# Altium project DT10965_MOTOR_CONTROLLER(1).PrjPcb (part 1 of 5)
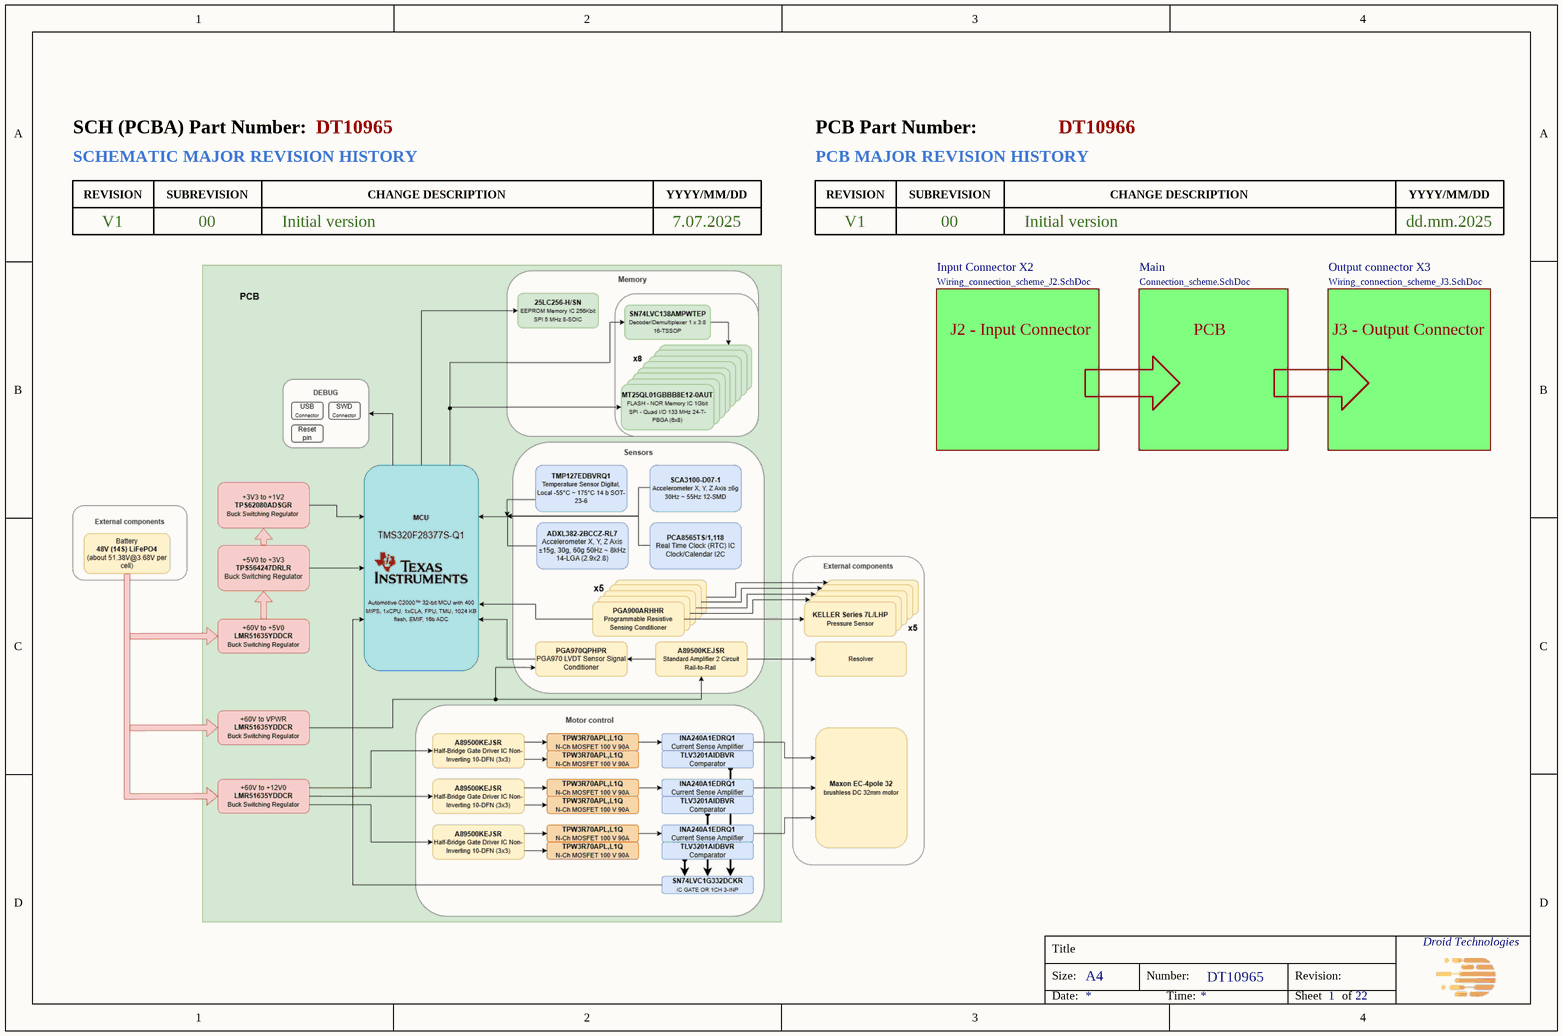
[diagram p0: Title.SchDoc]
CompanyName: Droid Technologies; DT_PCB_Number: DT10966; DT_PCB_Revision: 1.0; DT_SCH_Number: DT10965; DT_SCH_Revision: 1.0; DT_SCH_Title: MOTORCONTROLLER
16 sheets, 536 parts. Net scope: flat (ports and power ports of the same name join across sheets).
Sheets:
  Title.SchDoc
  Block_Diagram.SchDoc
  MCU.SchDoc
  MCU_debug.SchDoc
  Flash_memory.SchDoc
  EEPROM_memory.SchDoc
  Temp_sensor.SchDoc
  Accelerometers.SchDoc
  H-bridge.SchDoc
  Phase Current_Voltage Sense.SchDoc
  Resolver.SchDoc
  Pressure_sensor_AFE.SchDoc
  Calendar.SchDoc
  USB_interface.SchDoc
  Power_management.SchDoc
  Connections.SchDoc

## Sheet Title.SchDoc: =DT_SCH_Title
size A4; Organization: Droid Technologies; DocumentNumber: DT10965; Revision: 1.0; SheetNumber: 1; SheetTotal: 22

### Sub-sheets
Input Connector X2 = Wiring_connection_scheme_J2.SchDoc (file not in this document): no entries
Main = Connection_scheme.SchDoc (file not in this document): no entries
Output connector X3 = Wiring_connection_scheme_J3.SchDoc (file not in this document): no entries

### Notes on the sheet
- V1
- 00
- Initial version
- 7.07.2025
- dd.mm.2025
- J2 - Input Connector
- PCB
- J3 - Output Connector
- SCHEMATIC MAJOR REVISION HISTORY
- SCH (PCBA) Part Number:
- PCB MAJOR REVISION HISTORY
- PCB Part Number:
- REVISION
- SUBREVISION
- CHANGE DESCRIPTION
- YYYY/MM/DD
- Title
- Size:
- A4
- Number:
- Revision:
- Date:
- Time:
- Sheet
- of

## Sheet Block_Diagram.SchDoc: =DT_SCH_Title
size A4; Organization: Droid Technologies; DocumentNumber: DT10965; Revision: 1.0; SheetNumber: 2; SheetTotal: 16

### Notes on the sheet
- Title
- Size:
- A4
- Number:
- Revision:
- Date:
- Time:
- Sheet
- of
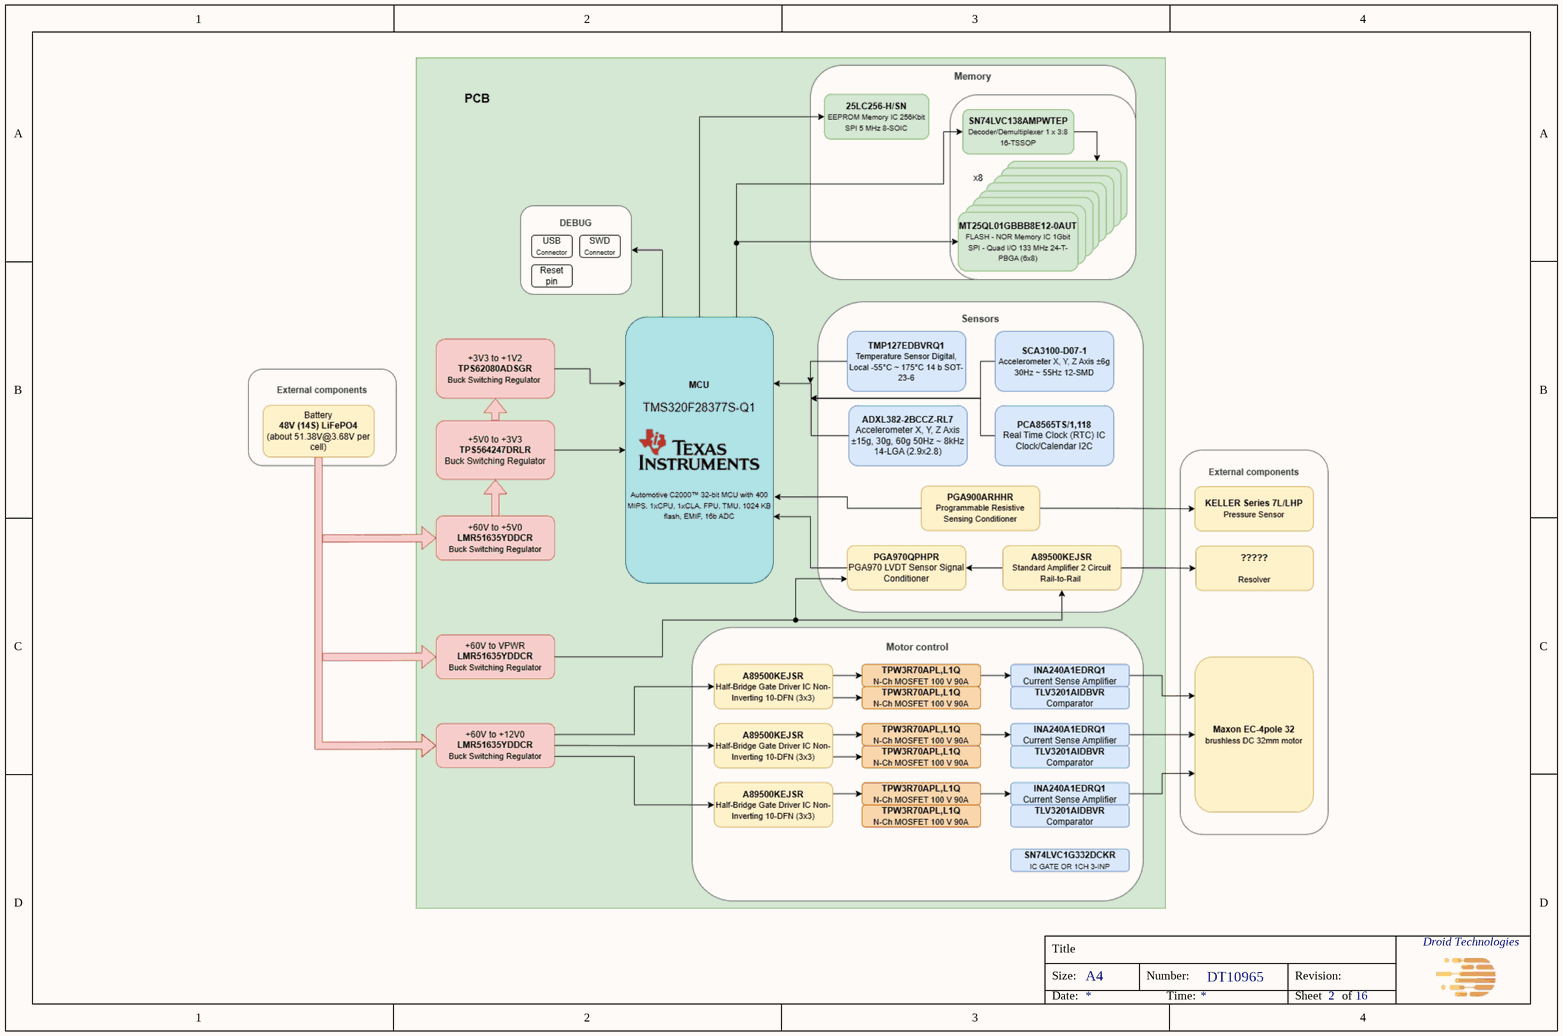
[diagram p1: Block_Diagram.SchDoc]

## Sheet MCU.SchDoc: =DT_SCH_Title
size A3; Organization: Droid Technologies; DocumentNumber: DT10965; Revision: 1.0; SheetNumber: 3; SheetTotal: 20
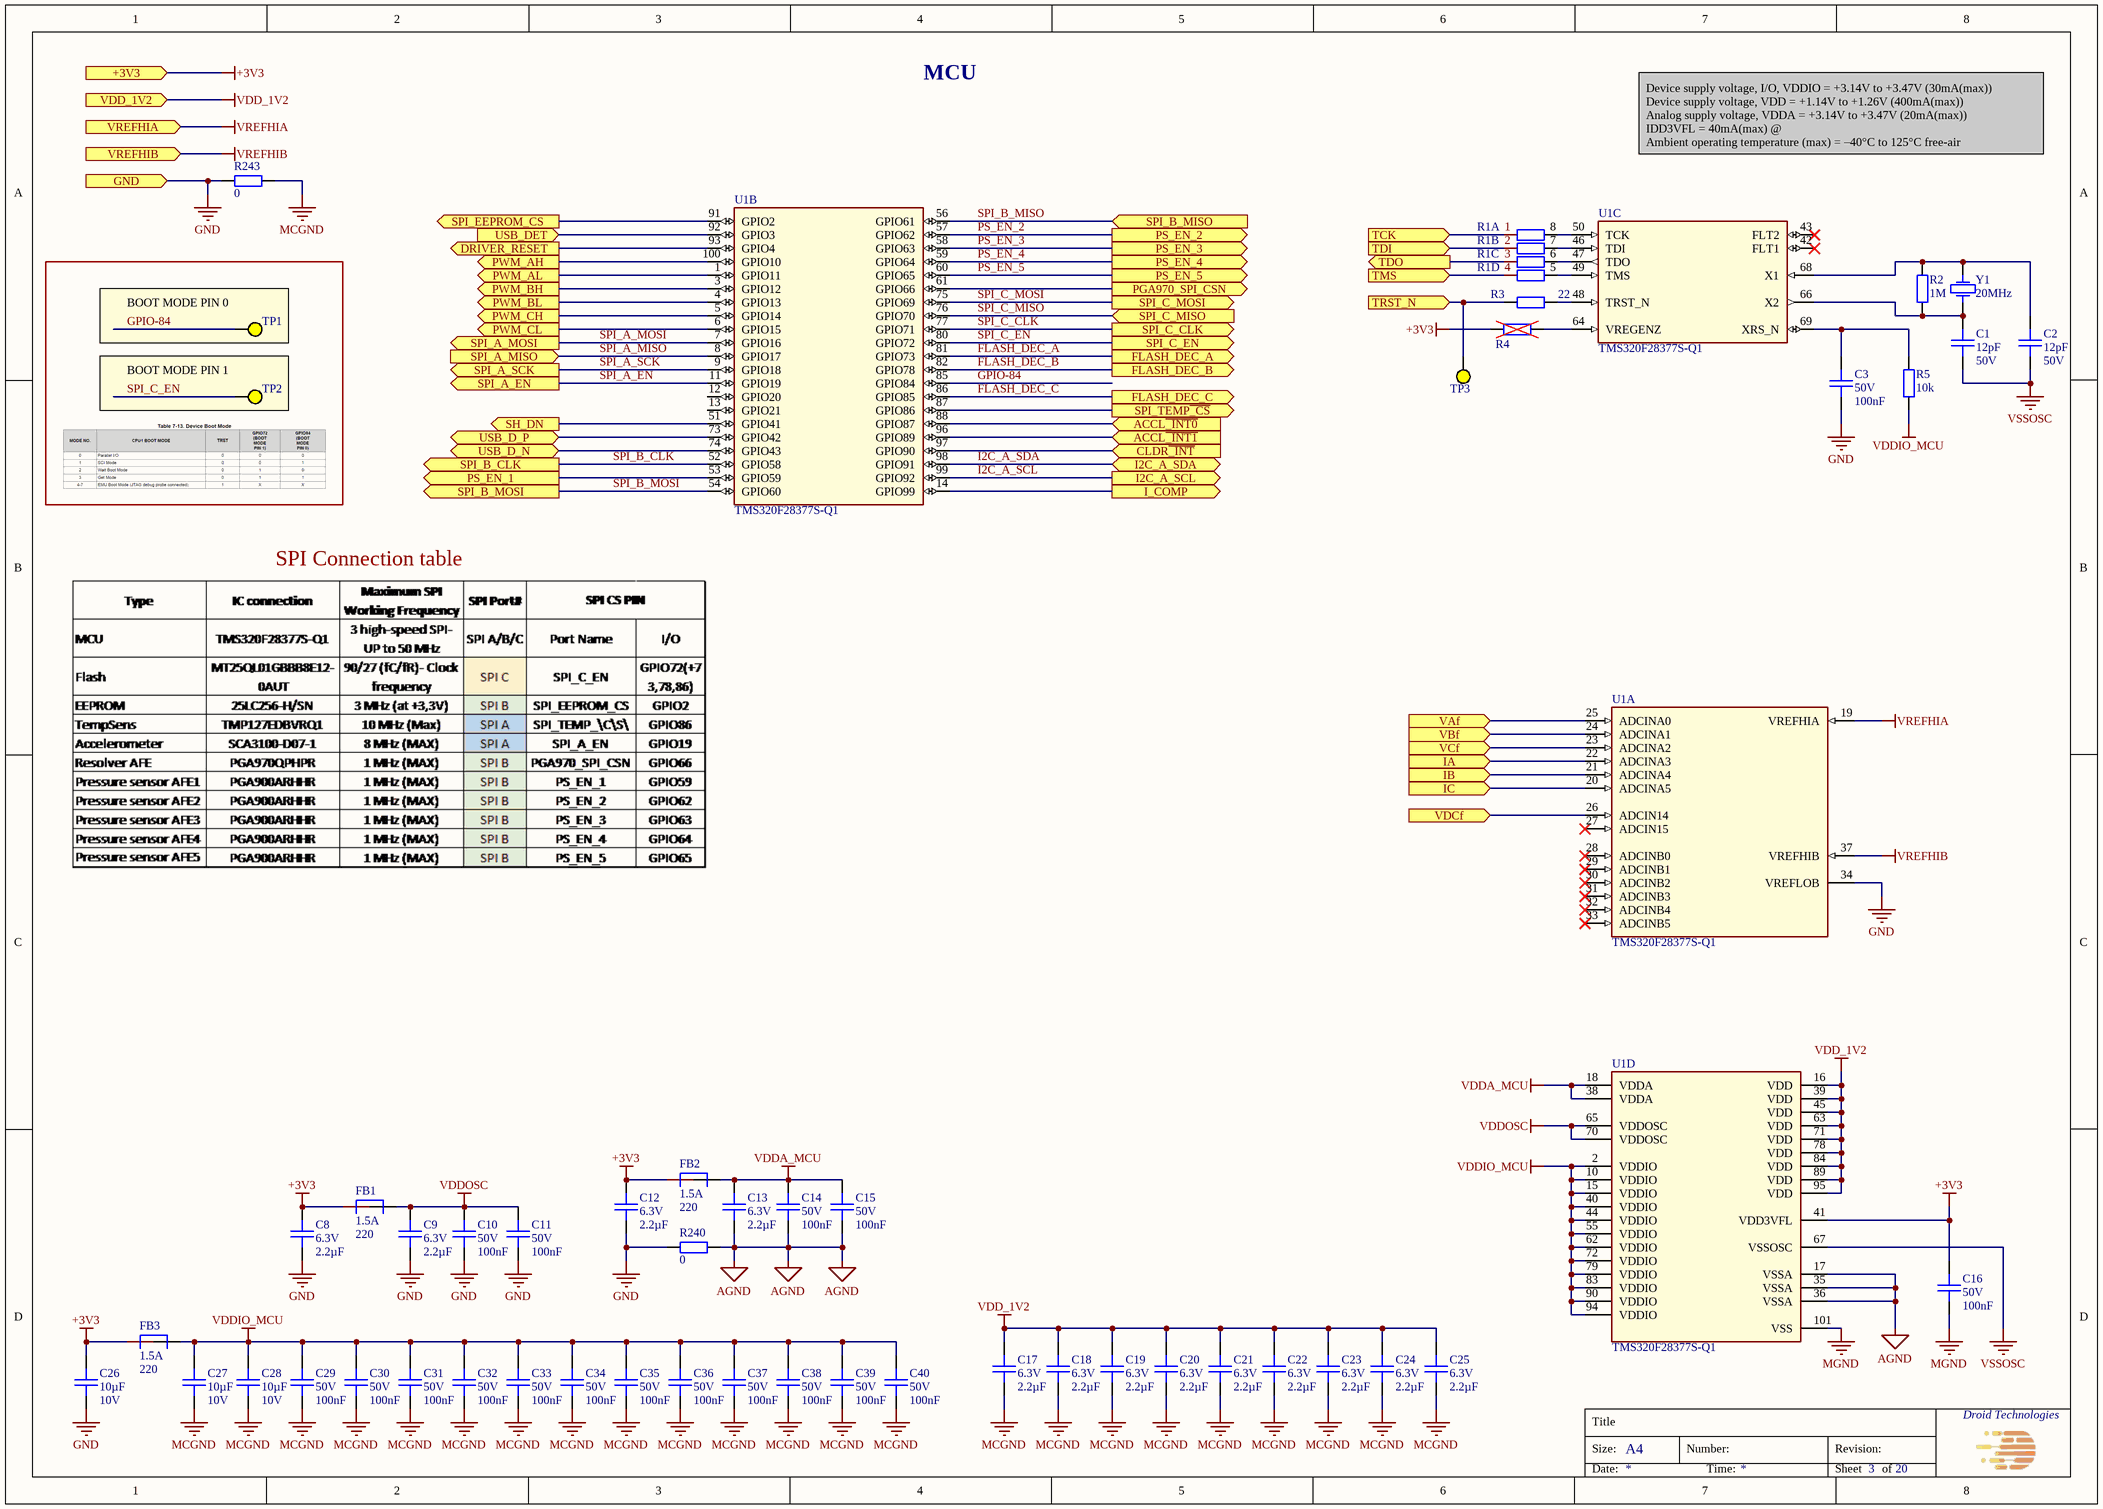
[diagram p2: MCU.SchDoc]

### Parts
C1  Capacitance: 12pF  Voltage Rating: 50V  [CAPC100x50x50L25]  (hidden comment: C0402C120J5HACAUTO)
C2  Capacitance: 12pF  Voltage Rating: 50V  [CAPC100x50x50L25]  (hidden comment: C0402C120J5HACAUTO)
C3  Voltage Rating: 50V  Capacitance: 100nF  [CAPC100x50x50L25]  (hidden comment: GCM155L8EH104KE07D)
C8  Voltage Rating: 6.3V  Capacitance: 2.2µF  [CAPC160X80X90L35]  (hidden comment: C1608X8L0J225K080AC)
C9  Voltage Rating: 6.3V  Capacitance: 2.2µF  [CAPC160X80X90L35]  (hidden comment: C1608X8L0J225K080AC)
C10  Voltage Rating: 50V  Capacitance: 100nF  [CAPC100x50x50L25]  (hidden comment: GCM155L8EH104KE07D)
C11  Voltage Rating: 50V  Capacitance: 100nF  [CAPC100x50x50L25]  (hidden comment: GCM155L8EH104KE07D)
C12  Voltage Rating: 6.3V  Capacitance: 2.2µF  [CAPC160X80X90L35]  (hidden comment: C1608X8L0J225K080AC)
C13  Voltage Rating: 6.3V  Capacitance: 2.2µF  [CAPC160X80X90L35]  (hidden comment: C1608X8L0J225K080AC)
C14  Voltage Rating: 50V  Capacitance: 100nF  [CAPC100x50x50L25]  (hidden comment: GCM155L8EH104KE07D)
C15  Voltage Rating: 50V  Capacitance: 100nF  [CAPC100x50x50L25]  (hidden comment: GCM155L8EH104KE07D)
C16  Voltage Rating: 50V  Capacitance: 100nF  [CAPC100x50x50L25]  (hidden comment: GCM155L8EH104KE07D)
C17  Voltage Rating: 6.3V  Capacitance: 2.2µF  [CAPC160X80X90L35]  (hidden comment: C1608X8L0J225K080AC)
C18  Voltage Rating: 6.3V  Capacitance: 2.2µF  [CAPC160X80X90L35]  (hidden comment: C1608X8L0J225K080AC)
C19  Voltage Rating: 6.3V  Capacitance: 2.2µF  [CAPC160X80X90L35]  (hidden comment: C1608X8L0J225K080AC)
C20  Voltage Rating: 6.3V  Capacitance: 2.2µF  [CAPC160X80X90L35]  (hidden comment: C1608X8L0J225K080AC)
C21  Voltage Rating: 6.3V  Capacitance: 2.2µF  [CAPC160X80X90L35]  (hidden comment: C1608X8L0J225K080AC)
C22  Voltage Rating: 6.3V  Capacitance: 2.2µF  [CAPC160X80X90L35]  (hidden comment: C1608X8L0J225K080AC)
C23  Voltage Rating: 6.3V  Capacitance: 2.2µF  [CAPC160X80X90L35]  (hidden comment: C1608X8L0J225K080AC)
C24  Voltage Rating: 6.3V  Capacitance: 2.2µF  [CAPC160X80X90L35]  (hidden comment: C1608X8L0J225K080AC)
C25  Voltage Rating: 6.3V  Capacitance: 2.2µF  [CAPC160X80X90L35]  (hidden comment: C1608X8L0J225K080AC)
C26  Capacitance: 10µF  Voltage Rating: 10V  [CAPC200X125X145L50]  (hidden comment: CGA4J1X8L1A106K125AC)
C27  Capacitance: 10µF  Voltage Rating: 10V  [CAPC200X125X145L50]  (hidden comment: CGA4J1X8L1A106K125AC)
C28  Capacitance: 10µF  Voltage Rating: 10V  [CAPC200X125X145L50]  (hidden comment: CGA4J1X8L1A106K125AC)
C29  Voltage Rating: 50V  Capacitance: 100nF  [CAPC100x50x50L25]  (hidden comment: GCM155L8EH104KE07D)
C30  Voltage Rating: 50V  Capacitance: 100nF  [CAPC100x50x50L25]  (hidden comment: GCM155L8EH104KE07D)
C31  Voltage Rating: 50V  Capacitance: 100nF  [CAPC100x50x50L25]  (hidden comment: GCM155L8EH104KE07D)
C32  Voltage Rating: 50V  Capacitance: 100nF  [CAPC100x50x50L25]  (hidden comment: GCM155L8EH104KE07D)
C33  Voltage Rating: 50V  Capacitance: 100nF  [CAPC100x50x50L25]  (hidden comment: GCM155L8EH104KE07D)
C34  Voltage Rating: 50V  Capacitance: 100nF  [CAPC100x50x50L25]  (hidden comment: GCM155L8EH104KE07D)
C35  Voltage Rating: 50V  Capacitance: 100nF  [CAPC100x50x50L25]  (hidden comment: GCM155L8EH104KE07D)
C36  Voltage Rating: 50V  Capacitance: 100nF  [CAPC100x50x50L25]  (hidden comment: GCM155L8EH104KE07D)
C37  Voltage Rating: 50V  Capacitance: 100nF  [CAPC100x50x50L25]  (hidden comment: GCM155L8EH104KE07D)
C38  Voltage Rating: 50V  Capacitance: 100nF  [CAPC100x50x50L25]  (hidden comment: GCM155L8EH104KE07D)
C39  Voltage Rating: 50V  Capacitance: 100nF  [CAPC100x50x50L25]  (hidden comment: GCM155L8EH104KE07D)
C40  Voltage Rating: 50V  Capacitance: 100nF  [CAPC100x50x50L25]  (hidden comment: GCM155L8EH104KE07D)
FB1  Imax: 1.5A  Impedance: 220  [BEADC160X80X95L40]  (hidden comment: BLM18KG221BH1D)
FB2  Imax: 1.5A  Impedance: 220  [BEADC160X80X95L40]  (hidden comment: BLM18KG221BH1D)
FB3  Imax: 1.5A  Impedance: 220  [BEADC160X80X95L40]  (hidden comment: BLM18KG221BH1D)
R1  EXB-N8V220JX  [RESCAV8P50_200X100X55L30X30]  (value not drawn)  (parts A,B,C,D of 4)
R2  Resistance: 1M  [RESC100X50X40L25]  (hidden comment: RC0402FR-071ML)
R3  Resistance: 22  [RESC100X50X40L25]  (hidden comment: RC0402FR-0722RL)
R4  DNP chip res 0603  [RESC160X80X55L30]  (value not drawn)
R5  Resistance: 10k  [RESC100X50X40L25]  (hidden comment: RC0402FR-0710KL)
R240  Resistance: 0  [RESC160X80X55L30]  (hidden comment: RC0603FR-070RL)
R243  Resistance: 0  [RESC160X80X55L30]  (hidden comment: RC0603FR-070RL)
TP1  Test Point  [TP_D1.5mm]  (value not drawn)  (no BOM)
TP2  Test Point  [TP_D1.5mm]  (value not drawn)  (no BOM)
TP3  Test Point  [TP_D0.75mm]  (value not drawn)
U1  TMS320F28377S-Q1  [100-HTQFP (14x14)]  (parts A,B,C,D of 4)
Y1  20MHz  [NX5032GA]

### Blocks framed on the sheet
BOOT MODE PIN 0: TP1
BOOT MODE PIN 1: TP2

### Ports
+3V3 (in), ACCL~{_INT0} (in), ACCL~{_INT1} (in), CLDR~{_INT} (in), DRIVER_RESET (out), FLASH_DEC_A (out), FLASH_DEC_B (out), FLASH_DEC_C (out), GND (in), I2C_A_SCL (out), I2C_A_SDA (bidir), I_COMP (out), IA (in), IB (in), IC (in), PGA970_SPI_CSN (out), PS_EN_1 (out), PS_EN_2 (out), PS_EN_3 (out), PS_EN_4 (out), PS_EN_5 (out), PWM_AH (out), PWM_AL (out), PWM_BH (out), PWM_BL (out), PWM_CH (out), PWM_CL (out), SH_DN (out), SPI_A_EN (out), SPI_A_MISO (in), SPI_A_MOSI (out), SPI_A_SCK (out), SPI_B_CLK (out), SPI_B_MISO (in), SPI_B_MOSI (out), SPI_C_CLK (out), SPI_C_EN (out), SPI_C_MISO (in), SPI_C_MOSI (out), SPI_EEPROM_CS (out), SPI_TEMP~{_CS} (out), TCK (in), TDI (in), TDO (out), TMS (in), TRST_N (in), USB_D_N (bidir), USB_D_P (bidir), USB_DET (in), VAf (in), VBf (in), VCf (in), VDCf (in), VDD_1V2 (in), VREFHIA (in), VREFHIB (in)

### Nets
+3V3: C8.2 C12.2 C16.2 C26.2 FB1.1 FB2.1 FB3.1 R4.2 U1.41(VDD3VFL) ; port +3V3
AGND: C13.1 C14.1 C15.1 R240.1 U1.17(VSSA) U1.35(VSSA) U1.36(VSSA)
GND: C3.1 C8.1 C9.1 C10.1 C11.1 C12.1 C26.1 R240.2 R243.2 U1.34(VREFLOB) ; port GND
MCGND: C17.1 C18.1 C19.1 C20.1 C21.1 C22.1 C23.1 C24.1 C25.1 C27.1 C28.1 C29.1 C30.1 C31.1 C32.1 C33.1 C34.1 C35.1 C36.1 C37.1 C38.1 C39.1 C40.1 R243.1
MGND: C16.1 U1.101(VSS)
VDD_1V2: C17.2 C18.2 C19.2 C20.2 C21.2 C22.2 C23.2 C24.2 C25.2 U1.16(VDD) U1.39(VDD) U1.45(VDD) U1.63(VDD) U1.71(VDD) U1.78(VDD) U1.84(VDD) U1.89(VDD) U1.95(VDD) ; port VDD_1V2
VDDA_MCU: C13.2 C14.2 C15.2 FB2.2 U1.18(VDDA) U1.38(VDDA)
VDDIO_MCU: C27.2 C28.2 C29.2 C30.2 C31.2 C32.2 C33.2 C34.2 C35.2 C36.2 C37.2 C38.2 C39.2 C40.2 FB3.2 R5.1 U1.2(VDDIO) U1.10(VDDIO) U1.15(VDDIO) U1.40(VDDIO) U1.44(VDDIO) U1.55(VDDIO) U1.62(VDDIO) U1.72(VDDIO) U1.79(VDDIO) U1.83(VDDIO) U1.90(VDDIO) U1.94(VDDIO)
VDDOSC: C9.2 C10.2 C11.2 FB1.2 U1.65(VDDOSC) U1.70(VDDOSC)
VREFHIA: U1.19(VREFHIA) ; port VREFHIA
VREFHIB: U1.37(VREFHIB) ; port VREFHIB
VSSOSC: C1.2 C2.2 U1.67(VSSOSC)
ACCL~{_INT0}: U1.88(GPIO87) ; port ACCL~{_INT0}
ACCL~{_INT1}: U1.96(GPIO89) ; port ACCL~{_INT1}
CLDR~{_INT}: U1.97(GPIO90) ; port CLDR~{_INT}
FLASH_DEC_A: U1.81(GPIO73) ; port FLASH_DEC_A
FLASH_DEC_B: U1.82(GPIO78) ; port FLASH_DEC_B
FLASH_DEC_C: U1.86(GPIO85) ; port FLASH_DEC_C
GPIO-84: TP1.1 U1.85(GPIO84)
I2C_A_SCL: U1.99(GPIO92) ; port I2C_A_SCL
I2C_A_SDA: U1.98(GPIO91) ; port I2C_A_SDA
I_COMP: U1.14(GPIO99) ; port I_COMP
IA: U1.22(ADCINA3) ; port IA
IB: U1.21(ADCINA4) ; port IB
IC: U1.20(ADCINA5) ; port IC
PS_EN_2: U1.57(GPIO62) ; port PS_EN_2
PS_EN_3: U1.58(GPIO63) ; port PS_EN_3
PS_EN_4: U1.59(GPIO64) ; port PS_EN_4
PS_EN_5: U1.60(GPIO65) ; port PS_EN_5
SPI_A_EN: U1.11(GPIO19) ; port SPI_A_EN
SPI_A_MISO: U1.8(GPIO17) ; port SPI_A_MISO
SPI_A_MOSI: U1.7(GPIO16) ; port SPI_A_MOSI
SPI_A_SCK: U1.9(GPIO18) ; port SPI_A_SCK
SPI_B_CLK: U1.52(GPIO58) ; port SPI_B_CLK
SPI_B_MISO: U1.56(GPIO61) ; port SPI_B_MISO
SPI_B_MOSI: U1.54(GPIO60) ; port SPI_B_MOSI
SPI_C_CLK: U1.77(GPIO71) ; port SPI_C_CLK
SPI_C_EN: TP2.1 U1.80(GPIO72) ; port SPI_C_EN
SPI_C_MISO: U1.76(GPIO70) ; port SPI_C_MISO
SPI_C_MOSI: U1.75(GPIO69) ; port SPI_C_MOSI
SPI_EEPROM_CS: U1.91(GPIO2) ; port SPI_EEPROM_CS
USB_D_N: U1.74(GPIO43) ; port USB_D_N
USB_D_P: U1.73(GPIO42) ; port USB_D_P
USB_DET: U1.92(GPIO3) ; port USB_DET
NetC1_1: C1.1 R2.1 U1.66(X2) Y1.1
NetC2_1: C2.1 R2.2 U1.68(X1) Y1.2
NetC3_2: C3.2 R5.2 U1.69(XRS_N)
NetJ1_1: R1.4 ; port TMS
NetJ1_2: R3.1 TP3.1 ; port TRST_N
NetJ1_3: R1.2 ; port TDI
NetJ1_7: R1.3 ; port TDO
NetJ1_9: R1.1 ; port TCK
NetR1_5: R1.5 U1.49(TMS)
NetR1_6: R1.6 U1.47(TDO)
NetR1_7: R1.7 U1.46(TDI)
NetR1_8: R1.8 U1.50(TCK)
NetR3_2: R3.2 U1.48(TRST_N)
NetR4_1: R4.1 U1.64(VREGENZ)
NetR92_1: U1.87(GPIO86) ; port SPI_TEMP~{_CS}
NetR115_1: U1.100(GPIO10) ; port PWM_AH
NetR117_1: U1.1(GPIO11) ; port PWM_AL
NetR120_1: U1.3(GPIO12) ; port PWM_BH
NetR122_1: U1.4(GPIO13) ; port PWM_BL
NetR125_1: U1.5(GPIO14) ; port PWM_CH
NetR127_1: U1.6(GPIO15) ; port PWM_CL
NetR169_2: U1.51(GPIO41) ; port SH_DN
NetR171_2: U1.61(GPIO66) ; port PGA970_SPI_CSN
NetU1_23: U1.23(ADCINA2) ; port VCf
NetU1_24: U1.24(ADCINA1) ; port VBf
NetU1_25: U1.25(ADCINA0) ; port VAf
NetU1_26: U1.26(ADCIN14) ; port VDCf
NetU1_53: U1.53(GPIO59) ; port PS_EN_1
NetU1_93: U1.93(GPIO4) ; port DRIVER_RESET

Not connected (* = marked no-connect by the designer): U1 12(GPIO20) 13(GPIO21) 27(ADCIN15)* 28(ADCINB0)* 29(ADCINB1)* 30(ADCINB2)* 31(ADCINB3)* 32(ADCINB4)* 33(ADCINB5)* 42(FLT1)* 43(FLT2)*

### Notes on the sheet
- MCU
- Device supply voltage, I/O, VDDIO = +3.14V to +3.47V (30mA(max))
  Device supply voltage, VDD = +1.14V to +1.26V (400mA(max))
  Analog supply voltage, VDDA = +3.14V to +3.47V (20mA(max))
  IDD3VFL = 40mA(max) @
  Ambient operating temperature (max) = –40°C to 125°C free-air
- SPI Connection table
- Title
- Size:
- A4
- Number:
- Revision:
- Date:
- Time:
- Sheet
- of

### Library data of the parts
C1 C2 = CMP-001-2042-2: CAP CER 0402 12PF 50V ULTRA STAB; Manufacturer: KEMET; Tolerance: 5%; Op Temp min: -55°C; Dielectric: X8R; Op Temp max: 150°C; ComponentLink3URL: https://www.digikey.com/en/products/detail/kemet/C0402C120J5HACAUTO/7955501; ComponentLink1Description: Datasheet; ComponentLink2URL: https://eu.mouser.com/ProductDetail/KEMET/C0402C120J5HACAUTO?qs=j%252B1pi9TdxUZTSOjjZ2f5wA%3D%3D; Size: 1.00mm x 0.50mm; ComponentLink2Description: Mouser; Ratings: AEC-Q200; ComponentLink3Description: Digikey; Mounting Type: SM; Lead Spacing: 0mm; MPN: C0402C120J5HACAUTO; ComponentLink1URL: https://search.kemet.com/component-documentation/download/specsheet/C0402C120J5HACAUTO; Height max: 550µm; Package: 0402 (1005 Metric)
C3 C10 C11 C14-C16 C29-C40 = CMP-001-1980-2: CAP CER 0.1UF 50V X8L 0402; Manufacturer: Murata Electronics; Op Temp max: 150°C; Op Temp min: -55°C; Tolerance: 10%; Height max: 550µm; ComponentLink3Description: Digikey; Mounting Type: SM; ComponentLink3URL: https://www.digikey.com/en/products/detail/murata-electronics/GCM155L8EH104KE07D/11618823; Package: 0402 (1005 Metric); Lead Spacing: 0mm; MPN: GCM155L8EH104KE07D; Size: 1.00mm x 0.50mm; Ratings: AEC-Q200; ComponentLink1URL: https://www.murata.com/en-us/products/productdetail?partno=GCM155L8EH104KE07%23; ComponentLink1Description: Datasheet; Dielectric: X8L; ComponentLink2Description: Mouser; ComponentLink2URL: https://eu.mouser.com/ProductDetail/Murata-Electronics/GCM155L8EH104KE07D?qs=1mbolxNpo8fQSHf0HYnZWw%3D%3D
C8 C9 C12 C13 C17-C25 = CMP-001-2044-2: CAP CER 2.2UF 6.3V X8L 0603; Manufacturer: TDK Corporation; Op Temp min: -55°C; Tolerance: 10%; Op Temp max: 150°C; ComponentLink1URL: https://product.tdk.com/en/search/capacitor/ceramic/mlcc/info?part_no=C1608X8L0J225K080AC; MPN: C1608X8L0J225K080AC; ComponentLink3URL: https://www.digikey.com/en/products/detail/tdk-corporation/C1608X8L0J225K080AC/8343784; ComponentLink1Description: Datasheet; Lead Spacing: 0mm; ComponentLink3Description: Digikey; Package: 0603 (1608 Metric); Height max: 900µm; Size: 1.60mm x 0.80mm; Dielectric: X8L; Ratings: -; Mounting Type: SM; ComponentLink2URL: https://eu.mouser.com/ProductDetail/TDK/C1608X8L0J225K080AC?qs=rrS6PyfT74dgREMaiAoT3Q%3D%3D; ComponentLink2Description: Mouser
C26-C28 = CMP-001-1984-2: CAP CER 10UF 10V X8L 0805; Manufacturer: TDK Corporation; Tolerance: 10%; Op Temp min: -55°C; Op Temp max: 150°C; ComponentLink3Description: Digikey; Mounting Type: SM; Ratings: AEC-Q200; ComponentLink1Description: Datasheet; ComponentLink3URL: https://www.digikey.com/en/products/detail/tdk-corporation/CGA4J1X8L1A106K125AC/9991388; Lead Spacing: 0mm; MPN: CGA4J1X8L1A106K125AC; Size: 2.00mm x 1.25mm; Height max: 1.5mm; ComponentLink2URL: https://eu.mouser.com/ProductDetail/TDK/CGA4J1X8L1A106K125AC?qs=gZXFycFWdANzH%252B2UvJJjtQ%3D%3D; Package: 0805 (2012 Metric); ComponentLink2Description: Mouser; Dielectric: X8L; ComponentLink1URL: https://product.tdk.com/en/search/capacitor/ceramic/mlcc/info?part_no=CGA4J1X8L1A106K125AC
FB1-FB3 = CMP-001-1981-1: FERRITE BEAD 220 OHM 0603 1LN; Manufacturer: Murata Electronics; DCR: 50m; Op Temp min: -55°C; Frequency: 100MHz; Op Temp max: 150°C; Number of Lines: 1; Mounting Type: SM; Size: 1.60mm x 0.80mm; ComponentLink2URL: https://eu.mouser.com/ProductDetail/Murata-Electronics/BLM18KG221BH1D?qs=sJ5gq5MLFXpgEHYBdWUtkQ%3D%3D; ComponentLink1Description: Datasheet; ComponentLink1URL: https://www.murata.com/en-us/products/productdata/8798137286686/QNFA9129.pdf; Lead Spacing: 0mm; Ratings: AEC-Q200; ComponentLink3Description: Digikey; ComponentLink3URL: https://www.digikey.com/en/products/detail/murata-electronics/BLM18KG221BH1D/6156000; Height max: 950µm; Package: 0603 (1608 Metric); ComponentLink2Description: Mouser; MPN: BLM18KG221BH1D
R1 = CMP-001-1215-2: RES ARRAY 4 RES 22 OHM 0804; Manufacturer: Panasonic Electronic Components; Temperature Coefficient: ±200ppm; Number of Resistors: 4; Tolerance: 5%; Op Temp min: -55°C; Power Per Element: 31mW; Op Temp max: 125°C; Resistance: 22; Ratings: -; ComponentLink2Description: Mouser; ComponentLink1Description: Datasheet; Number of Pins: 8; Size: 2.00mm x 1.00mm; ComponentLink3Description: Digikey; Height max: 550µm; ComponentLink2URL: https://eu.mouser.com/ProductDetail/Panasonic/EXB-N8V220JX?qs=bx0%2FPCyAc7556mtSQRzOoA%3D%3D; Resistor-Ratio-Drift: -; ComponentLink1URL: https://industrial.panasonic.com/cdbs/www-data/pdf/AOC0000/AOC0000C14.pdf; Package: 0804, Concave, Long Side Terminals; ComponentLink3URL: https://www.digikey.com/en/products/detail/panasonic-electronic-components/EXB-N8V220JX/671714; Resistor Matching Ratio: -; MPN: EXB-N8V220JX; Mounting Type: SM
R2 = CMP-00539-4: RES 1M OHM 1% 1/16W 0402; Manufacturer: YAGEO; Op Temp max: 155°C; Op Temp min: -55°C; Temperature Coefficient: ±100ppm; Power: 63mW; Ratings: -; ComponentLink2URL: https://eu.mouser.com/ProductDetail/YAGEO/RC0402FR-071ML?qs=V1yeUXFNrknfoI4987wfBQ%3D%3D; Height max: 400µm; ComponentLink1Description: Datasheet; Mounting Type: SM; ComponentLink2Description: Mouser; Package: 0402 (1005 Metric); ComponentLink3URL: https://www.digikey.com/en/products/detail/yageo/RC0402FR-071ML/726515; MPN: RC0402FR-071ML; Tolerance: 1%; ComponentLink1URL: https://www.yageo.com/upload/media/product/productsearch/datasheet/rchip/PYu-RC_Group_51_RoHS_L_12.pdf; Composition: Thick Film; Size: 1.00mm x 0.50mm; ComponentLink3Description: Digikey
R3 = CMP-001-0482-4: RES 22 OHM 1% 1/16W 0402; Manufacturer: YAGEO; Temperature Coefficient: ±100ppm; Op Temp max: 155°C; Op Temp min: -55°C; Power: 63mW; Ratings: -; ComponentLink3URL: https://www.digikey.com/en/products/detail/yageo/RC0402FR-0722RL/726562; ComponentLink2URL: https://eu.mouser.com/ProductDetail/YAGEO/RC0402FR-0722RL?qs=V1yeUXFNrkkRg6zf08ADKQ%3D%3D; MPN: RC0402FR-0722RL; ComponentLink1Description: Datasheet; ComponentLink3Description: Digikey; Tolerance: 1%; Size: 1.00mm x 0.50mm; ComponentLink1URL: https://www.yageo.com/upload/media/product/productsearch/datasheet/rchip/PYu-RC_Group_51_RoHS_L_12.pdf; Composition: Thick Film; ComponentLink2Description: Mouser; Mounting Type: SM; Package: 0402 (1005 Metric); Height max: 400µm
R4 = CMP-001-0920-3: DNP res 0603; Mounting Type: SM; MPN: DNP; Package: 0603 (1608 Metric)
R5 = CMP-00010-6: RES 10K OHM 1% 1/16W 0402; Manufacturer: YAGEO; Op Temp max: 155°C; Op Temp min: -55°C; Power: 63mW; Temperature Coefficient: ±100ppm; ComponentLink3URL: https://www.digikey.com/en/products/detail/yageo/RC0402FR-0710KL/726523; ComponentLink1Description: Datasheet; Height max: 400µm; ComponentLink3Description: Digikey; ComponentLink2URL: https://www2.mouser.com/ProductDetail/YAGEO/RC0402FR-0710KL?qs=%2Fha2pyFaduhjtLcYvKXQ8NAGbRXkQ%2Fwl6RsvWHeV66MSeqLhkcF3rg%3D%3D; Ratings: -; MPN: RC0402FR-0710KL; ComponentLink1URL: https://www.yageo.com/upload/media/product/productsearch/datasheet/rchip/PYu-RC_Group_51_RoHS_L_12.pdf; ComponentLink2Description: Mouser; Mounting Type: SM; Tolerance: 1%; Composition: Thick Film; Size: 1.00mm x 0.50mm; Package: 0402 (1005 Metric)
R240 R243 = CMP-001-0927-2: RES 0 OHM JUMPER 1/10W 0603; Manufacturer: YAGEO; Op Temp min: -55°C; Op Temp max: 155°C; Power: 100mW; Tolerance: 0%; Height max: 550µm; ComponentLink2URL: https://eu.mouser.com/ProductDetail/YAGEO/RC0603FR-070RL?qs=0yPvnVz5%2FmpDQv43TwvCfw%3D%3D; Temperature Coefficient: -; ComponentLink3Description: Digikey; ComponentLink2Description: Mouser; MPN: RC0603FR-070RL; ComponentLink1URL: https://www.yageo.com/upload/media/product/productsearch/datasheet/rchip/PYu-RC_Group_51_RoHS_L_12.pdf; Ratings: -; Size: 1.60mm x 0.80mm; Composition: Thick Film; Mounting Type: SM; ComponentLink3URL: https://www.digikey.com/en/products/detail/yageo/RC0603FR-070RL/1304008; Package: 0603 (1608 Metric); ComponentLink1Description: Datasheet
TP1 TP2 = TP_1.5
TP3 = TP_0.75: Test point 0.75mm
U1 = TMS320F28377SPZPQ: IC MCU 32BIT 1MB FLASH 100HTQFP; Manufacturer: Texas Instruments; MPN: TMS320F28377SPZPQ
Y1 = STDCSU2-20M: CRYSTAL 20.0000MHZ 8PF SMD; Manufacturer: NDK (NIHON DEMPA KOGYO CO., LTD); MPN: STDCSU2-20M

## Sheet MCU_debug.SchDoc: =DT_SCH_Title
size A4; Organization: Droid Technologies; DocumentNumber: DT10965; Revision: 1.0; SheetNumber: 4; SheetTotal: 20
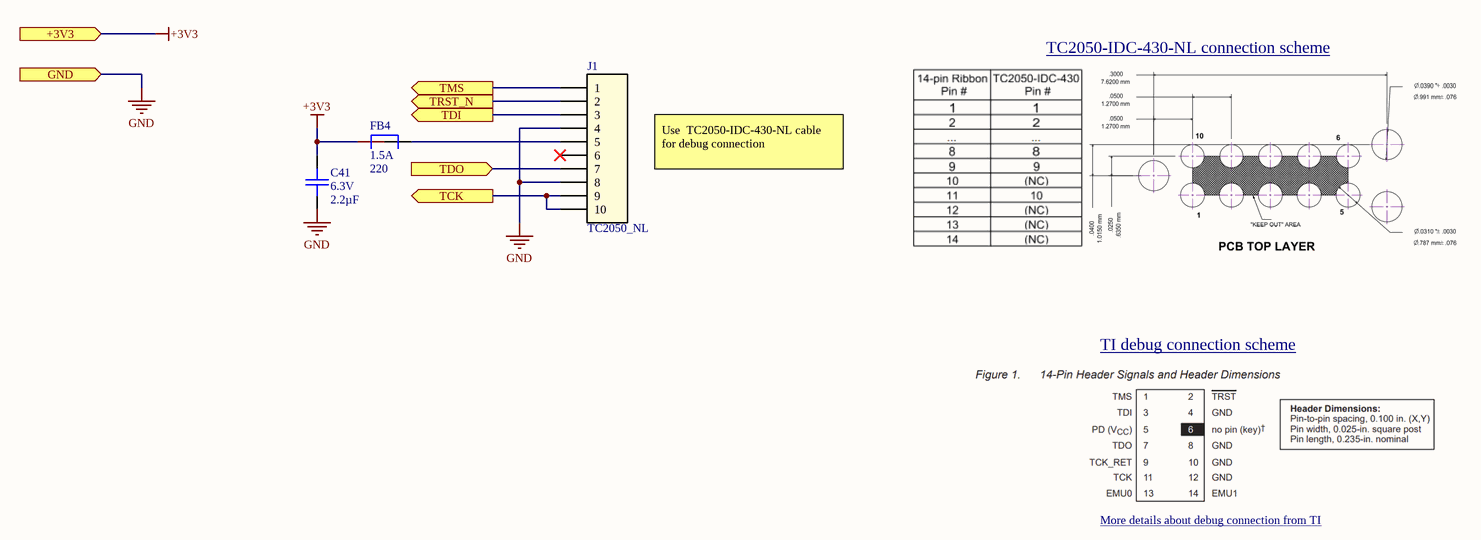
[diagram p3: MCU_debug.SchDoc]

### Parts
C41  Voltage Rating: 6.3V  Capacitance: 2.2µF  [CAPC160X80X90L35]  (hidden comment: C1608X8L0J225K080AC)
FB4  Imax: 1.5A  Impedance: 220  [BEADC160X80X95L40]  (hidden comment: BLM18KG221BH1D)
J1  TC2050_NL  [CONN__TAG_TC2050-IDC-NL]

### Ports
+3V3 (in), GND (in), TCK (out), TDI (out), TDO (in), TMS (out), TRST_N (out)

### Nets
+3V3: C41.2 FB4.1 ; port +3V3
GND: C41.1 J1.4 J1.8 ; port GND
NetFB4_2: FB4.2 J1.5
NetJ1_1: J1.1 ; port TMS
NetJ1_2: J1.2 ; port TRST_N
NetJ1_3: J1.3 ; port TDI
NetJ1_7: J1.7 ; port TDO
NetJ1_9: J1.9 J1.10 ; port TCK

Not connected (* = marked no-connect by the designer): J1 6*

### Notes on the sheet
- TC2050-IDC-430-NL connection scheme <https://www.tag-connect.com/wp-content/uploads/bsk-pdf-manager/TC2050-IDC-430-NL_Datasheet_9.pdf>
- Use  TC2050-IDC-430-NL cable for debug connection
- TI debug connection scheme <https://www.ti.com/lit/ug/spru641/spru641.pdf>
- More details about debug connection from TI <https://software-dl.ti.com/ccs/esd/documents/xdsdebugprobes/emu_jtag_connectors.html#connector-information>
- Title
- Size:
- A4
- Number:
- Revision:
- Date:
- Time:
- Sheet
- of

### Library data of the parts
C41 = CMP-001-2044-2: as C8 on sheet MCU; ComponentLink1URL: https://product.tdk.com/en/search/capacitor/ceramic/mlcc/info?part_no=C1608X8L0J225K080AC; MPN: C1608X8L0J225K080AC; ComponentLink3URL: https://www.digikey.com/en/products/detail/tdk-corporation/C1608X8L0J225K080AC/8343784; ComponentLink1Description: Datasheet; Lead Spacing: 0mm; ComponentLink3Description: Digikey; Package: 0603 (1608 Metric); Height max: 900µm; Size: 1.60mm x 0.80mm; Dielectric: X8L; Ratings: -; Mounting Type: SM; ComponentLink2URL: https://eu.mouser.com/ProductDetail/TDK/C1608X8L0J225K080AC?qs=rrS6PyfT74dgREMaiAoT3Q%3D%3D; ComponentLink2Description: Mouser
FB4 = CMP-001-1981-1: as FB1 on sheet MCU; Mounting Type: SM; Size: 1.60mm x 0.80mm; ComponentLink2URL: https://eu.mouser.com/ProductDetail/Murata-Electronics/BLM18KG221BH1D?qs=sJ5gq5MLFXpgEHYBdWUtkQ%3D%3D; ComponentLink1Description: Datasheet; ComponentLink1URL: https://www.murata.com/en-us/products/productdata/8798137286686/QNFA9129.pdf; Lead Spacing: 0mm; Ratings: AEC-Q200; ComponentLink3Description: Digikey; ComponentLink3URL: https://www.digikey.com/en/products/detail/murata-electronics/BLM18KG221BH1D/6156000; Height max: 950µm; Package: 0603 (1608 Metric); ComponentLink2Description: Mouser; MPN: BLM18KG221BH1D
J1 = CONN_TC2050_NL: PLUG-OF-NAILS 10-PIN W/O LEGS 8"; Manufacturer: Tag-Connect LLC; MPN: TC2050; Series: Plug-Of-Nails™; ComponentLink1Description: Datasheet; ComponentLink1URL: https://www.tag-connect.com/wp-content/uploads/bsk-pdf-manager/TC2050-IDC-NL_Datasheet_8.pdf; ComponentLink2Description: DigiKey; ComponentLink2URL: https://www.digikey.pl/en/products/detail/tag-connect-llc/TC2030-IDC/4571121

## Sheet Flash_memory.SchDoc: =DT_SCH_Title
size A3; Organization: Droid Technologies; DocumentNumber: DT10965; Revision: 1.0; SheetNumber: 5; SheetTotal: 18
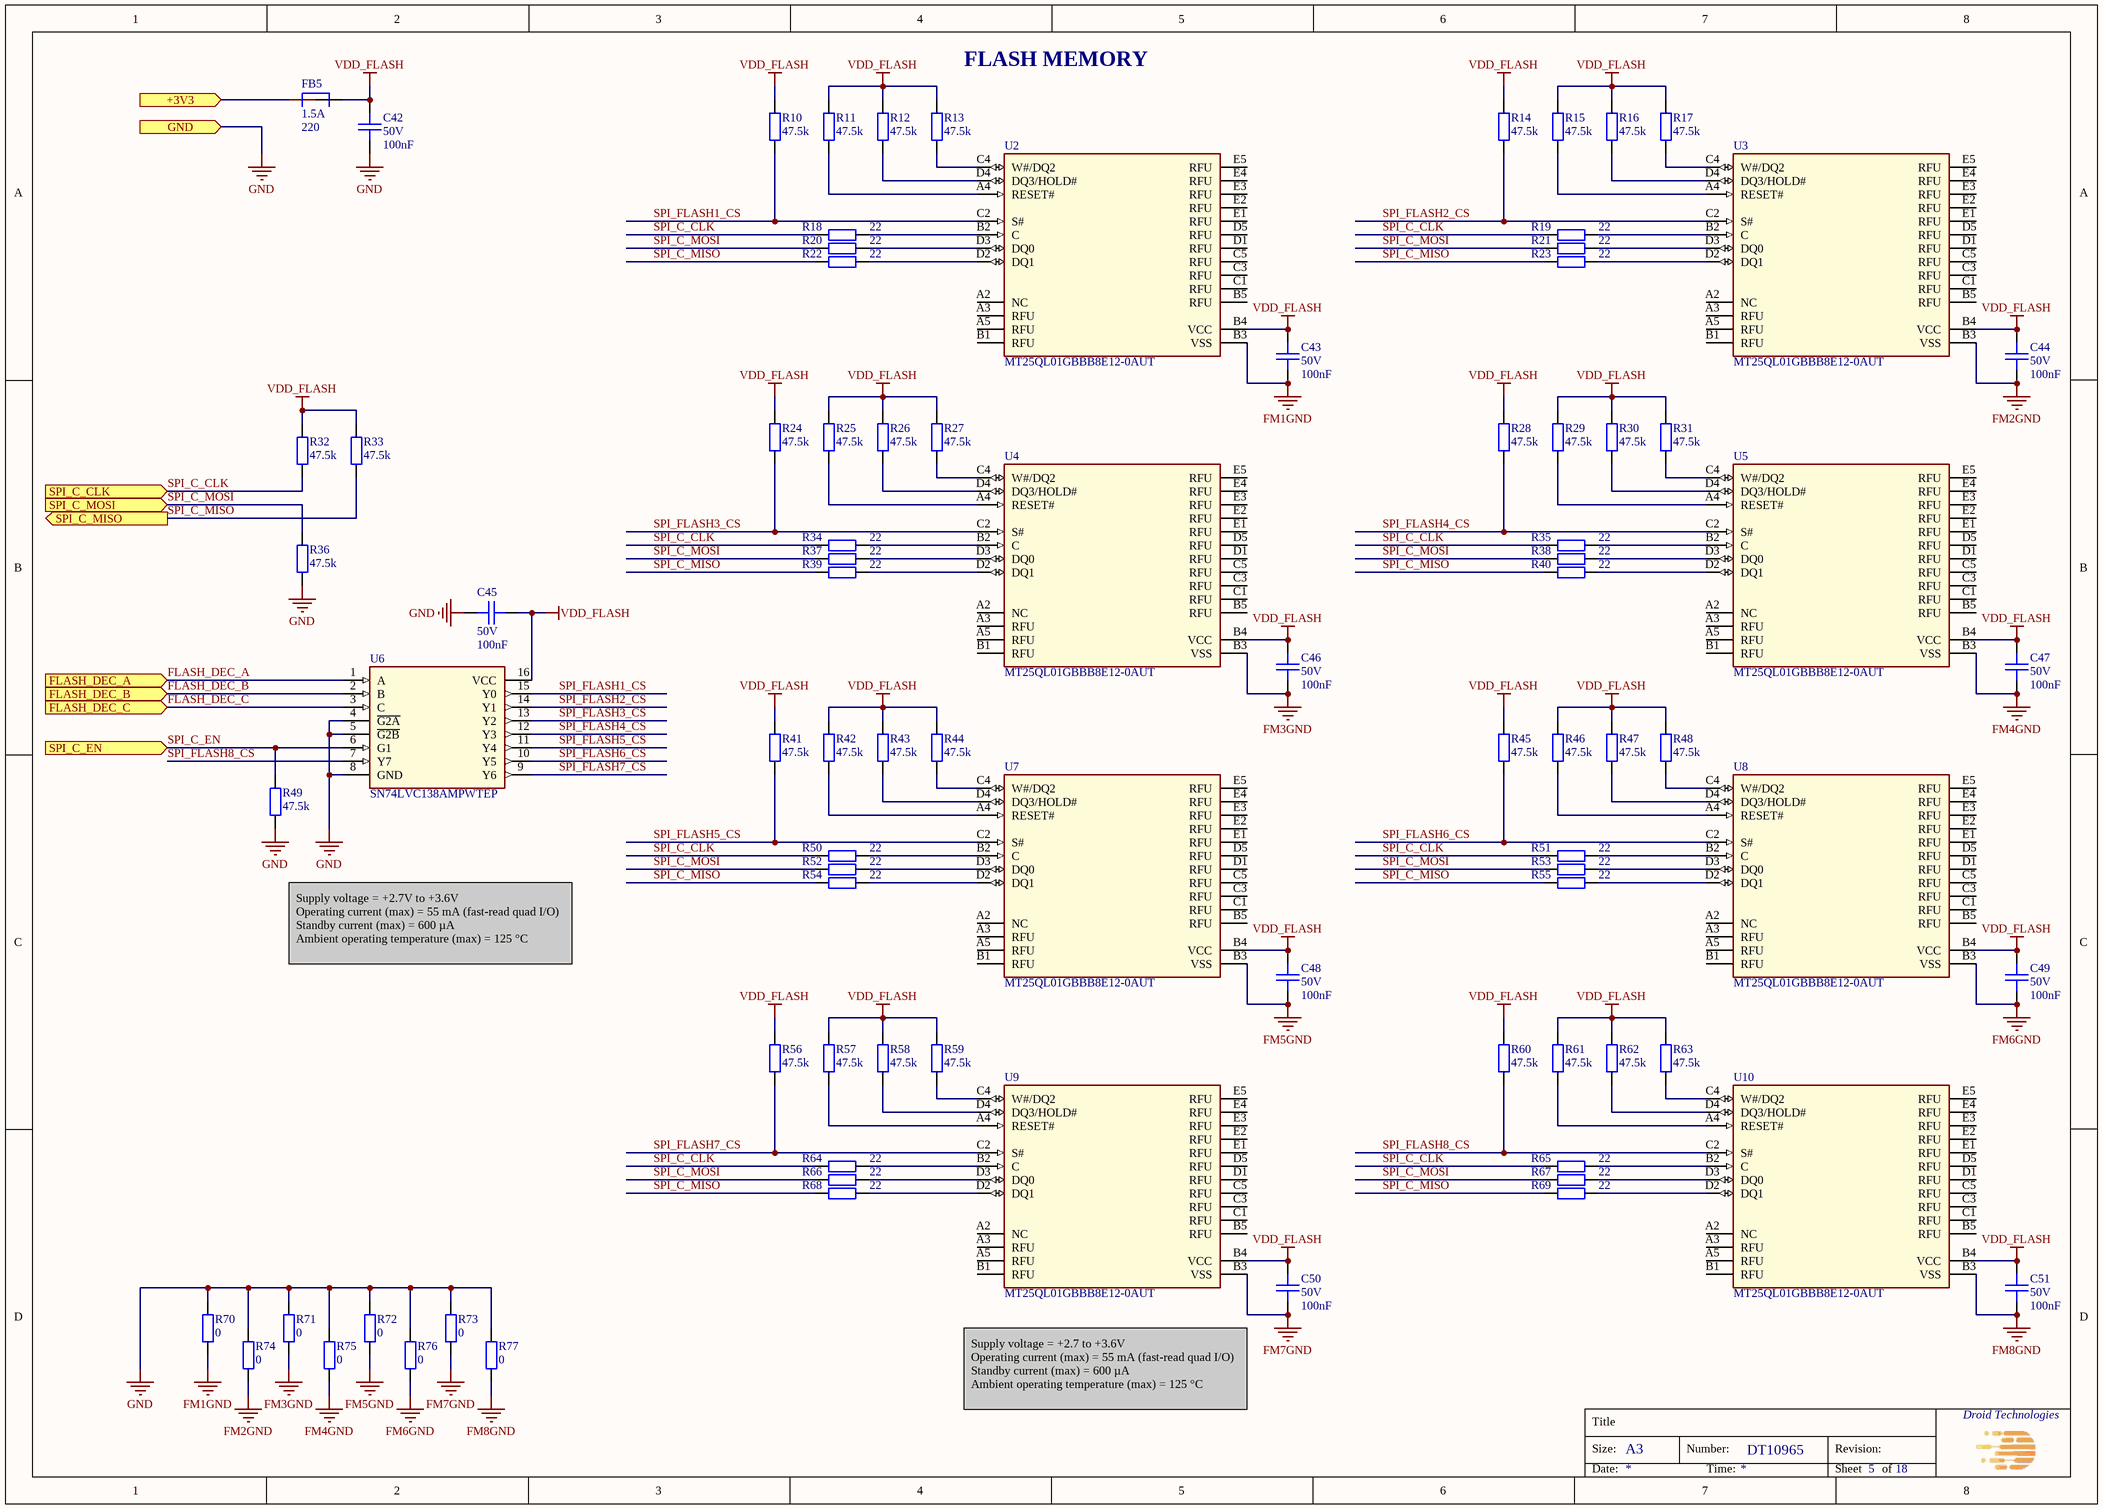
[diagram p4: Flash_memory.SchDoc]

### Parts
C42  Voltage Rating: 50V  Capacitance: 100nF  [CAPC100x50x50L25]  (hidden comment: GCM155L8EH104KE07D)
C43  Voltage Rating: 50V  Capacitance: 100nF  [CAPC100x50x50L25]  (hidden comment: GCM155L8EH104KE07D)
C44  Voltage Rating: 50V  Capacitance: 100nF  [CAPC100x50x50L25]  (hidden comment: GCM155L8EH104KE07D)
C45  Voltage Rating: 50V  Capacitance: 100nF  [CAPC100x50x50L25]  (hidden comment: GCM155L8EH104KE07D)
C46  Voltage Rating: 50V  Capacitance: 100nF  [CAPC100x50x50L25]  (hidden comment: GCM155L8EH104KE07D)
C47  Voltage Rating: 50V  Capacitance: 100nF  [CAPC100x50x50L25]  (hidden comment: GCM155L8EH104KE07D)
C48  Voltage Rating: 50V  Capacitance: 100nF  [CAPC100x50x50L25]  (hidden comment: GCM155L8EH104KE07D)
C49  Voltage Rating: 50V  Capacitance: 100nF  [CAPC100x50x50L25]  (hidden comment: GCM155L8EH104KE07D)
C50  Voltage Rating: 50V  Capacitance: 100nF  [CAPC100x50x50L25]  (hidden comment: GCM155L8EH104KE07D)
C51  Voltage Rating: 50V  Capacitance: 100nF  [CAPC100x50x50L25]  (hidden comment: GCM155L8EH104KE07D)
FB5  Imax: 1.5A  Impedance: 220  [BEADC160X80X95L40]  (hidden comment: BLM18KG221BH1D)
R10  Resistance: 47.5k  [RESC100X50X40L25]  (hidden comment: RC0402FR-0747K5L)
R11  Resistance: 47.5k  [RESC100X50X40L25]  (hidden comment: RC0402FR-0747K5L)
R12  Resistance: 47.5k  [RESC100X50X40L25]  (hidden comment: RC0402FR-0747K5L)
R13  Resistance: 47.5k  [RESC100X50X40L25]  (hidden comment: RC0402FR-0747K5L)
R14  Resistance: 47.5k  [RESC100X50X40L25]  (hidden comment: RC0402FR-0747K5L)
R15  Resistance: 47.5k  [RESC100X50X40L25]  (hidden comment: RC0402FR-0747K5L)
R16  Resistance: 47.5k  [RESC100X50X40L25]  (hidden comment: RC0402FR-0747K5L)
R17  Resistance: 47.5k  [RESC100X50X40L25]  (hidden comment: RC0402FR-0747K5L)
R18  Resistance: 22  [RESC100X50X40L25]  (hidden comment: RC0402FR-0722RL)
R19  Resistance: 22  [RESC100X50X40L25]  (hidden comment: RC0402FR-0722RL)
R20  Resistance: 22  [RESC100X50X40L25]  (hidden comment: RC0402FR-0722RL)
R21  Resistance: 22  [RESC100X50X40L25]  (hidden comment: RC0402FR-0722RL)
R22  Resistance: 22  [RESC100X50X40L25]  (hidden comment: RC0402FR-0722RL)
R23  Resistance: 22  [RESC100X50X40L25]  (hidden comment: RC0402FR-0722RL)
R24  Resistance: 47.5k  [RESC100X50X40L25]  (hidden comment: RC0402FR-0747K5L)
R25  Resistance: 47.5k  [RESC100X50X40L25]  (hidden comment: RC0402FR-0747K5L)
R26  Resistance: 47.5k  [RESC100X50X40L25]  (hidden comment: RC0402FR-0747K5L)
R27  Resistance: 47.5k  [RESC100X50X40L25]  (hidden comment: RC0402FR-0747K5L)
R28  Resistance: 47.5k  [RESC100X50X40L25]  (hidden comment: RC0402FR-0747K5L)
R29  Resistance: 47.5k  [RESC100X50X40L25]  (hidden comment: RC0402FR-0747K5L)
R30  Resistance: 47.5k  [RESC100X50X40L25]  (hidden comment: RC0402FR-0747K5L)
R31  Resistance: 47.5k  [RESC100X50X40L25]  (hidden comment: RC0402FR-0747K5L)
R32  Resistance: 47.5k  [RESC100X50X40L25]  (hidden comment: RC0402FR-0747K5L)
R33  Resistance: 47.5k  [RESC100X50X40L25]  (hidden comment: RC0402FR-0747K5L)
R34  Resistance: 22  [RESC100X50X40L25]  (hidden comment: RC0402FR-0722RL)
R35  Resistance: 22  [RESC100X50X40L25]  (hidden comment: RC0402FR-0722RL)
R36  Resistance: 47.5k  [RESC100X50X40L25]  (hidden comment: RC0402FR-0747K5L)
R37  Resistance: 22  [RESC100X50X40L25]  (hidden comment: RC0402FR-0722RL)
R38  Resistance: 22  [RESC100X50X40L25]  (hidden comment: RC0402FR-0722RL)
R39  Resistance: 22  [RESC100X50X40L25]  (hidden comment: RC0402FR-0722RL)
R40  Resistance: 22  [RESC100X50X40L25]  (hidden comment: RC0402FR-0722RL)
R41  Resistance: 47.5k  [RESC100X50X40L25]  (hidden comment: RC0402FR-0747K5L)
R42  Resistance: 47.5k  [RESC100X50X40L25]  (hidden comment: RC0402FR-0747K5L)
R43  Resistance: 47.5k  [RESC100X50X40L25]  (hidden comment: RC0402FR-0747K5L)
R44  Resistance: 47.5k  [RESC100X50X40L25]  (hidden comment: RC0402FR-0747K5L)
R45  Resistance: 47.5k  [RESC100X50X40L25]  (hidden comment: RC0402FR-0747K5L)
R46  Resistance: 47.5k  [RESC100X50X40L25]  (hidden comment: RC0402FR-0747K5L)
R47  Resistance: 47.5k  [RESC100X50X40L25]  (hidden comment: RC0402FR-0747K5L)
R48  Resistance: 47.5k  [RESC100X50X40L25]  (hidden comment: RC0402FR-0747K5L)
R49  Resistance: 47.5k  [RESC100X50X40L25]  (hidden comment: RC0402FR-0747K5L)
R50  Resistance: 22  [RESC100X50X40L25]  (hidden comment: RC0402FR-0722RL)
R51  Resistance: 22  [RESC100X50X40L25]  (hidden comment: RC0402FR-0722RL)
R52  Resistance: 22  [RESC100X50X40L25]  (hidden comment: RC0402FR-0722RL)
R53  Resistance: 22  [RESC100X50X40L25]  (hidden comment: RC0402FR-0722RL)
R54  Resistance: 22  [RESC100X50X40L25]  (hidden comment: RC0402FR-0722RL)
R55  Resistance: 22  [RESC100X50X40L25]  (hidden comment: RC0402FR-0722RL)
R56  Resistance: 47.5k  [RESC100X50X40L25]  (hidden comment: RC0402FR-0747K5L)
R57  Resistance: 47.5k  [RESC100X50X40L25]  (hidden comment: RC0402FR-0747K5L)
R58  Resistance: 47.5k  [RESC100X50X40L25]  (hidden comment: RC0402FR-0747K5L)
R59  Resistance: 47.5k  [RESC100X50X40L25]  (hidden comment: RC0402FR-0747K5L)
R60  Resistance: 47.5k  [RESC100X50X40L25]  (hidden comment: RC0402FR-0747K5L)
R61  Resistance: 47.5k  [RESC100X50X40L25]  (hidden comment: RC0402FR-0747K5L)
R62  Resistance: 47.5k  [RESC100X50X40L25]  (hidden comment: RC0402FR-0747K5L)
R63  Resistance: 47.5k  [RESC100X50X40L25]  (hidden comment: RC0402FR-0747K5L)
R64  Resistance: 22  [RESC100X50X40L25]  (hidden comment: RC0402FR-0722RL)
R65  Resistance: 22  [RESC100X50X40L25]  (hidden comment: RC0402FR-0722RL)
R66  Resistance: 22  [RESC100X50X40L25]  (hidden comment: RC0402FR-0722RL)
R67  Resistance: 22  [RESC100X50X40L25]  (hidden comment: RC0402FR-0722RL)
R68  Resistance: 22  [RESC100X50X40L25]  (hidden comment: RC0402FR-0722RL)
R69  Resistance: 22  [RESC100X50X40L25]  (hidden comment: RC0402FR-0722RL)
R70  Resistance: 0  [RESC160X80X55L30]  (hidden comment: RC0603FR-070RL)
R71  Resistance: 0  [RESC160X80X55L30]  (hidden comment: RC0603FR-070RL)
R72  Resistance: 0  [RESC160X80X55L30]  (hidden comment: RC0603FR-070RL)
R73  Resistance: 0  [RESC160X80X55L30]  (hidden comment: RC0603FR-070RL)
R74  Resistance: 0  [RESC160X80X55L30]  (hidden comment: RC0603FR-070RL)
R75  Resistance: 0  [RESC160X80X55L30]  (hidden comment: RC0603FR-070RL)
R76  Resistance: 0  [RESC160X80X55L30]  (hidden comment: RC0603FR-070RL)
R77  Resistance: 0  [RESC160X80X55L30]  (hidden comment: RC0603FR-070RL)
U2  MT25QL01GBBB8E12-0AUT  [24-T-PBGA (6x8)]
U3  MT25QL01GBBB8E12-0AUT  [24-T-PBGA (6x8)]
U4  MT25QL01GBBB8E12-0AUT  [24-T-PBGA (6x8)]
U5  MT25QL01GBBB8E12-0AUT  [24-T-PBGA (6x8)]
U6  SN74LVC138AMPWTEP  [TSSOP16]
U7  MT25QL01GBBB8E12-0AUT  [24-T-PBGA (6x8)]
U8  MT25QL01GBBB8E12-0AUT  [24-T-PBGA (6x8)]
U9  MT25QL01GBBB8E12-0AUT  [24-T-PBGA (6x8)]
U10  MT25QL01GBBB8E12-0AUT  [24-T-PBGA (6x8)]

### Ports
+3V3 (in), FLASH_DEC_A (in), FLASH_DEC_B (in), FLASH_DEC_C (in), GND (in), SPI_C_CLK (in), SPI_C_EN (in), SPI_C_MISO (out), SPI_C_MOSI (in)

### Nets
+3V3: FB5.1 ; port +3V3
FM1GND: C43.1 R70.1 U2.B3(VSS)
FM2GND: C44.1 R74.1 U3.B3(VSS)
FM3GND: C46.1 R71.1 U4.B3(VSS)
FM4GND: C47.1 R75.1 U5.B3(VSS)
FM5GND: C48.1 R72.1 U7.B3(VSS)
FM6GND: C49.1 R76.1 U8.B3(VSS)
FM7GND: C50.1 R73.1 U9.B3(VSS)
FM8GND: C51.1 R77.1 U10.B3(VSS)
GND: C42.1 C45.1 R36.1 R49.1 R70.2 R71.2 R72.2 R73.2 R74.2 R75.2 R76.2 R77.2 U6.4(~{G2A}) U6.5(~{G2B}) U6.8(GND) ; port GND
VDD_FLASH: C42.2 C43.2 C44.2 C45.2 C46.2 C47.2 C48.2 C49.2 C50.2 C51.2 FB5.2 R10.2 R11.2 R12.2 R13.2 R14.2 R15.2 R16.2 R17.2 R24.2 R25.2 R26.2 R27.2 R28.2 R29.2 R30.2 R31.2 R32.2 R33.2 R41.2 R42.2 R43.2 R44.2 R45.2 R46.2 R47.2 R48.2 R56.2 R57.2 R58.2 R59.2 R60.2 R61.2 R62.2 R63.2 U2.B4(VCC) U3.B4(VCC) U4.B4(VCC) U5.B4(VCC) U6.16(VCC) U7.B4(VCC) U8.B4(VCC) U9.B4(VCC) U10.B4(VCC)
FLASH_DEC_A: U6.1(A) ; port FLASH_DEC_A
FLASH_DEC_B: U6.2(B) ; port FLASH_DEC_B
FLASH_DEC_C: U6.3(C) ; port FLASH_DEC_C
SPI_C_CLK: R18.1 R19.1 R32.1 R34.1 R35.1 R50.1 R51.1 R64.1 R65.1 ; port SPI_C_CLK
SPI_C_EN: R49.2 U6.6(G1) ; port SPI_C_EN
SPI_C_MISO: R22.1 R23.1 R33.1 R39.1 R40.1 R54.1 R55.1 R68.1 R69.1 ; port SPI_C_MISO
SPI_C_MOSI: R20.1 R21.1 R36.2 R37.1 R38.1 R52.1 R53.1 R66.1 R67.1 ; port SPI_C_MOSI
SPI_FLASH1_CS: R10.1 U2.C2(S#) U6.15(Y0)
SPI_FLASH2_CS: R14.1 U3.C2(S#) U6.14(Y1)
SPI_FLASH3_CS: R24.1 U4.C2(S#) U6.13(Y2)
SPI_FLASH4_CS: R28.1 U5.C2(S#) U6.12(Y3)
SPI_FLASH5_CS: R41.1 U6.11(Y4) U7.C2(S#)
SPI_FLASH6_CS: R45.1 U6.10(Y5) U8.C2(S#)
SPI_FLASH7_CS: R56.1 U6.9(Y6) U9.C2(S#)
SPI_FLASH8_CS: R60.1 U6.7(Y7) U10.C2(S#)
NetR11_1: R11.1 U2.A4(RESET#)
NetR12_1: R12.1 U2.D4(DQ3/HOLD#)
NetR13_1: R13.1 U2.C4(W#/DQ2)
NetR15_1: R15.1 U3.A4(RESET#)
NetR16_1: R16.1 U3.D4(DQ3/HOLD#)
NetR17_1: R17.1 U3.C4(W#/DQ2)
NetR18_2: R18.2 U2.B2(C)
NetR19_2: R19.2 U3.B2(C)
NetR20_2: R20.2 U2.D3(DQ0)
NetR21_2: R21.2 U3.D3(DQ0)
NetR22_2: R22.2 U2.D2(DQ1)
NetR23_2: R23.2 U3.D2(DQ1)
NetR25_1: R25.1 U4.A4(RESET#)
NetR26_1: R26.1 U4.D4(DQ3/HOLD#)
NetR27_1: R27.1 U4.C4(W#/DQ2)
NetR29_1: R29.1 U5.A4(RESET#)
NetR30_1: R30.1 U5.D4(DQ3/HOLD#)
NetR31_1: R31.1 U5.C4(W#/DQ2)
NetR34_2: R34.2 U4.B2(C)
NetR35_2: R35.2 U5.B2(C)
NetR37_2: R37.2 U4.D3(DQ0)
NetR38_2: R38.2 U5.D3(DQ0)
NetR39_2: R39.2 U4.D2(DQ1)
NetR40_2: R40.2 U5.D2(DQ1)
NetR42_1: R42.1 U7.A4(RESET#)
NetR43_1: R43.1 U7.D4(DQ3/HOLD#)
NetR44_1: R44.1 U7.C4(W#/DQ2)
NetR46_1: R46.1 U8.A4(RESET#)
NetR47_1: R47.1 U8.D4(DQ3/HOLD#)
NetR48_1: R48.1 U8.C4(W#/DQ2)
NetR50_2: R50.2 U7.B2(C)
NetR51_2: R51.2 U8.B2(C)
NetR52_2: R52.2 U7.D3(DQ0)
NetR53_2: R53.2 U8.D3(DQ0)
NetR54_2: R54.2 U7.D2(DQ1)
NetR55_2: R55.2 U8.D2(DQ1)
NetR57_1: R57.1 U9.A4(RESET#)
NetR58_1: R58.1 U9.D4(DQ3/HOLD#)
NetR59_1: R59.1 U9.C4(W#/DQ2)
NetR61_1: R61.1 U10.A4(RESET#)
NetR62_1: R62.1 U10.D4(DQ3/HOLD#)
NetR63_1: R63.1 U10.C4(W#/DQ2)
NetR64_2: R64.2 U9.B2(C)
NetR65_2: R65.2 U10.B2(C)
NetR66_2: R66.2 U9.D3(DQ0)
NetR67_2: R67.2 U10.D3(DQ0)
NetR68_2: R68.2 U9.D2(DQ1)
NetR69_2: R69.2 U10.D2(DQ1)

Not connected (* = marked no-connect by the designer): U2 A2(NC) A3(RFU) A5(RFU) B1(RFU) B5(RFU) C1(RFU) C3(RFU) C5(RFU) D1(RFU) D5(RFU) E1(RFU) E2(RFU) E3(RFU) E4(RFU) E5(RFU); U3 A2(NC) A3(RFU) A5(RFU) B1(RFU) B5(RFU) C1(RFU) C3(RFU) C5(RFU) D1(RFU) D5(RFU) E1(RFU) E2(RFU) E3(RFU) E4(RFU) E5(RFU); U4 A2(NC) A3(RFU) A5(RFU) B1(RFU) B5(RFU) C1(RFU) C3(RFU) C5(RFU) D1(RFU) D5(RFU) E1(RFU) E2(RFU) E3(RFU) E4(RFU) E5(RFU); U5 A2(NC) A3(RFU) A5(RFU) B1(RFU) B5(RFU) C1(RFU) C3(RFU) C5(RFU) D1(RFU) D5(RFU) E1(RFU) E2(RFU) E3(RFU) E4(RFU) E5(RFU); U7 A2(NC) A3(RFU) A5(RFU) B1(RFU) B5(RFU) C1(RFU) C3(RFU) C5(RFU) D1(RFU) D5(RFU) E1(RFU) E2(RFU) E3(RFU) E4(RFU) E5(RFU); U8 A2(NC) A3(RFU) A5(RFU) B1(RFU) B5(RFU) C1(RFU) C3(RFU) C5(RFU) D1(RFU) D5(RFU) E1(RFU) E2(RFU) E3(RFU) E4(RFU) E5(RFU); U9 A2(NC) A3(RFU) A5(RFU) B1(RFU) B5(RFU) C1(RFU) C3(RFU) C5(RFU) D1(RFU) D5(RFU) E1(RFU) E2(RFU) E3(RFU) E4(RFU) E5(RFU); U10 A2(NC) A3(RFU) A5(RFU) B1(RFU) B5(RFU) C1(RFU) C3(RFU) C5(RFU) D1(RFU) D5(RFU) E1(RFU) E2(RFU) E3(RFU) E4(RFU) E5(RFU)

### Notes on the sheet
- (near R13) FLASH MEMORY
- Supply voltage = +2.7V to +3.6V
  Operating current (max) = 55 mA (fast-read quad I/O)
  Standby current (max) = 600 µA
  Ambient operating temperature (max) = 125 °C
- Supply voltage = +2.7 to +3.6V
  Operating current (max) = 55 mA (fast-read quad I/O)
  Standby current (max) = 600 µA
  Ambient operating temperature (max) = 125 °C
- Title
- Size:
- A3
- Number:
- Revision:
- Date:
- Time:
- Sheet
- of

### Library data of the parts
C42-C51 = CMP-001-1980-2: as C3 on sheet MCU; Height max: 550µm; ComponentLink3Description: Digikey; Mounting Type: SM; ComponentLink3URL: https://www.digikey.com/en/products/detail/murata-electronics/GCM155L8EH104KE07D/11618823; Package: 0402 (1005 Metric); Lead Spacing: 0mm; MPN: GCM155L8EH104KE07D; Size: 1.00mm x 0.50mm; Ratings: AEC-Q200; ComponentLink1URL: https://www.murata.com/en-us/products/productdetail?partno=GCM155L8EH104KE07%23; ComponentLink1Description: Datasheet; Dielectric: X8L; ComponentLink2Description: Mouser; ComponentLink2URL: https://eu.mouser.com/ProductDetail/Murata-Electronics/GCM155L8EH104KE07D?qs=1mbolxNpo8fQSHf0HYnZWw%3D%3D
FB5 = CMP-001-1981-1: as FB1 on sheet MCU; Mounting Type: SM; Size: 1.60mm x 0.80mm; ComponentLink2URL: https://eu.mouser.com/ProductDetail/Murata-Electronics/BLM18KG221BH1D?qs=sJ5gq5MLFXpgEHYBdWUtkQ%3D%3D; ComponentLink1Description: Datasheet; ComponentLink1URL: https://www.murata.com/en-us/products/productdata/8798137286686/QNFA9129.pdf; Lead Spacing: 0mm; Ratings: AEC-Q200; ComponentLink3Description: Digikey; ComponentLink3URL: https://www.digikey.com/en/products/detail/murata-electronics/BLM18KG221BH1D/6156000; Height max: 950µm; Package: 0603 (1608 Metric); ComponentLink2Description: Mouser; MPN: BLM18KG221BH1D
R10-R17 R24-R33 R36 R41-R49 R56-R63 = CMP-001-0277-7: RES 47.5K OHM 1% 1/16W 0402; Manufacturer: YAGEO; Op Temp min: -55°C; Power: 63mW; Temperature Coefficient: ±100ppm; Op Temp max: 155°C; ComponentLink1URL: https://www.yageo.com/upload/media/product/productsearch/datasheet/rchip/PYu-RC_Group_51_RoHS_L_12.pdf; ComponentLink1Description: Datasheet; MPN: RC0402FR-0747K5L; ComponentLink3Description: Digikey; ComponentLink2URL: https://eu.mouser.com/ProductDetail/YAGEO/RC0402FR-0747K5L?qs=V1yeUXFNrklfu86Rfgihxg%3D%3D; Mounting Type: SM; Tolerance: 1%; Package: 0402 (1005 Metric); Height max: 400µm; ComponentLink2Description: Mouser; ComponentLink3URL: https://www.digikey.com/en/products/detail/yageo/RC0402FR-0747K5L/726617; Size: 1.00mm x 0.50mm; Composition: Thick Film; Ratings: -
R18-R23 R34 R35 R37-R40 R50-R55 R64-R69 = CMP-001-0482-4: as R3 on sheet MCU; Ratings: -; ComponentLink3URL: https://www.digikey.com/en/products/detail/yageo/RC0402FR-0722RL/726562; ComponentLink2URL: https://eu.mouser.com/ProductDetail/YAGEO/RC0402FR-0722RL?qs=V1yeUXFNrkkRg6zf08ADKQ%3D%3D; MPN: RC0402FR-0722RL; ComponentLink1Description: Datasheet; ComponentLink3Description: Digikey; Tolerance: 1%; Size: 1.00mm x 0.50mm; ComponentLink1URL: https://www.yageo.com/upload/media/product/productsearch/datasheet/rchip/PYu-RC_Group_51_RoHS_L_12.pdf; Composition: Thick Film; ComponentLink2Description: Mouser; Mounting Type: SM; Package: 0402 (1005 Metric); Height max: 400µm
R70-R77 = CMP-001-0927-2: as R240 on sheet MCU; Height max: 550µm; ComponentLink2URL: https://eu.mouser.com/ProductDetail/YAGEO/RC0603FR-070RL?qs=0yPvnVz5%2FmpDQv43TwvCfw%3D%3D; Temperature Coefficient: -; ComponentLink3Description: Digikey; ComponentLink2Description: Mouser; MPN: RC0603FR-070RL; ComponentLink1URL: https://www.yageo.com/upload/media/product/productsearch/datasheet/rchip/PYu-RC_Group_51_RoHS_L_12.pdf; Ratings: -; Size: 1.60mm x 0.80mm; Composition: Thick Film; Mounting Type: SM; ComponentLink3URL: https://www.digikey.com/en/products/detail/yageo/RC0603FR-070RL/1304008; Package: 0603 (1608 Metric); ComponentLink1Description: Datasheet
U2-U5 U7-U10 = MT25QL01GBBB8E12-0AUT: IC FLASH 1GBIT SPI 24TPBGA; Manufacturer: Micron Technology Inc.; MPN: MT25QL01GBBB8E12-0AUT
U6 = SN74LVC138AMPWTEP: IC DECODER/DEMUX 1X3:8 16-TSSOP; Manufacturer: Texas Instruments; MPN: SN74LVC138AMPWTEP

## Sheet EEPROM_memory.SchDoc: =DT_SCH_Title
size A4; Organization: Droid Technologies; DocumentNumber: DT10965; Revision: 1.0; SheetNumber: 6; SheetTotal: 18
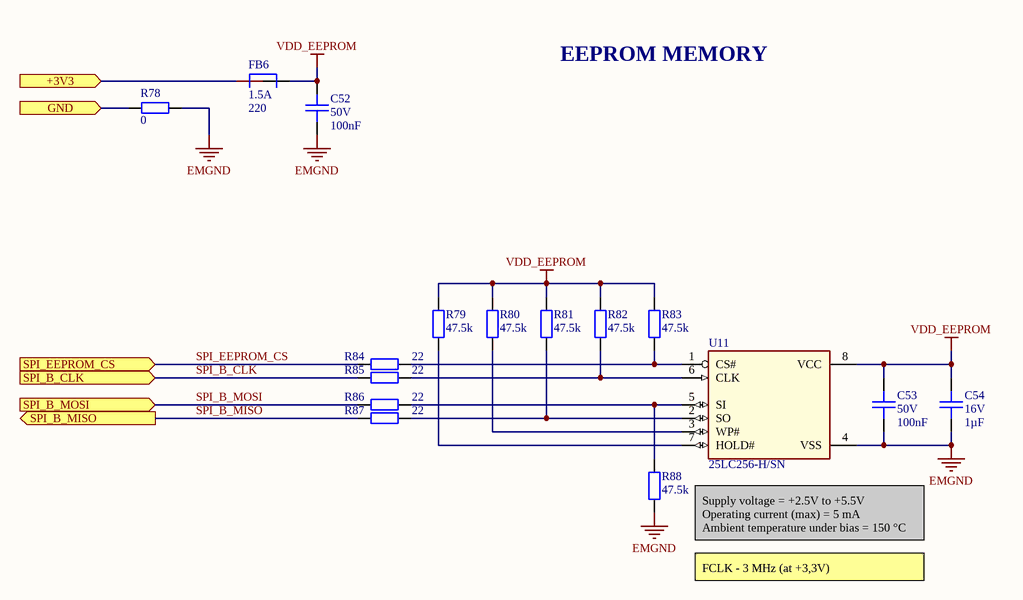
[diagram p5: EEPROM_memory.SchDoc]

### Parts
C52  Voltage Rating: 50V  Capacitance: 100nF  [CAPC100x50x50L25]  (hidden comment: GCM155L8EH104KE07D)
C53  Voltage Rating: 50V  Capacitance: 100nF  [CAPC100x50x50L25]  (hidden comment: GCM155L8EH104KE07D)
C54  Voltage Rating: 16V  Capacitance: 1µF  [CAPC160X80X90L35]  (hidden comment: GCG188L8EE105KA07D)
FB6  Imax: 1.5A  Impedance: 220  [BEADC160X80X95L40]  (hidden comment: BLM18KG221BH1D)
R78  Resistance: 0  [RESC160X80X55L30]  (hidden comment: RC0603FR-070RL)
R79  Resistance: 47.5k  [RESC100X50X40L25]  (hidden comment: RC0402FR-0747K5L)
R80  Resistance: 47.5k  [RESC100X50X40L25]  (hidden comment: RC0402FR-0747K5L)
R81  Resistance: 47.5k  [RESC100X50X40L25]  (hidden comment: RC0402FR-0747K5L)
R82  Resistance: 47.5k  [RESC100X50X40L25]  (hidden comment: RC0402FR-0747K5L)
R83  Resistance: 47.5k  [RESC100X50X40L25]  (hidden comment: RC0402FR-0747K5L)
R84  Resistance: 22  [RESC100X50X40L25]  (hidden comment: RC0402FR-0722RL)
R85  Resistance: 22  [RESC100X50X40L25]  (hidden comment: RC0402FR-0722RL)
R86  Resistance: 22  [RESC100X50X40L25]  (hidden comment: RC0402FR-0722RL)
R87  Resistance: 22  [RESC100X50X40L25]  (hidden comment: RC0402FR-0722RL)
R88  Resistance: 47.5k  [RESC100X50X40L25]  (hidden comment: RC0402FR-0747K5L)
U11  25LC256-H/SN  [SOIC8P127_490X600X175L70X41]

### Ports
+3V3 (in), GND (in), SPI_B_CLK (in), SPI_B_MISO (out), SPI_B_MOSI (in), SPI_EEPROM_CS (in)

### Nets
+3V3: FB6.1 ; port +3V3
EMGND: C52.1 C53.1 C54.1 R78.1 R88.1 U11.4(VSS)
GND: R78.2 ; port GND
VDD_EEPROM: C52.2 C53.2 C54.2 FB6.2 R79.2 R80.2 R81.2 R82.2 R83.2 U11.8(VCC)
SPI_B_CLK: R85.1 ; port SPI_B_CLK
SPI_B_MISO: R87.1 ; port SPI_B_MISO
SPI_B_MOSI: R86.1 ; port SPI_B_MOSI
SPI_EEPROM_CS: R84.1 ; port SPI_EEPROM_CS
NetR79_1: R79.1 U11.7(HOLD#)
NetR80_1: R80.1 U11.3(WP#)
NetR81_1: R81.1 R87.2 U11.2(SO)
NetR82_1: R82.1 R85.2 U11.6(CLK)
NetR83_1: R83.1 R84.2 U11.1(CS#)
NetR86_2: R86.2 R88.2 U11.5(SI)

### Notes on the sheet
- EEPROM MEMORY
- Supply voltage = +2.5V to +5.5V
  Operating current (max) = 5 mA
  Ambient temperature under bias = 150 °C
- FCLK - 3 MHz (at +3,3V)
- Title
- Size:
- A4
- Number:
- Revision:
- Date:
- Time:
- Sheet
- of

### Library data of the parts
C52 C53 = CMP-001-1980-2: as C3 on sheet MCU; Height max: 550µm; ComponentLink3Description: Digikey; Mounting Type: SM; ComponentLink3URL: https://www.digikey.com/en/products/detail/murata-electronics/GCM155L8EH104KE07D/11618823; Package: 0402 (1005 Metric); Lead Spacing: 0mm; MPN: GCM155L8EH104KE07D; Size: 1.00mm x 0.50mm; Ratings: AEC-Q200; ComponentLink1URL: https://www.murata.com/en-us/products/productdetail?partno=GCM155L8EH104KE07%23; ComponentLink1Description: Datasheet; Dielectric: X8L; ComponentLink2Description: Mouser; ComponentLink2URL: https://eu.mouser.com/ProductDetail/Murata-Electronics/GCM155L8EH104KE07D?qs=1mbolxNpo8fQSHf0HYnZWw%3D%3D
C54 = CMP-001-1982-2: CAP CER 1UF 16V X8L 0603; Manufacturer: Murata Electronics; Tolerance: 10%; Op Temp min: -55°C; Op Temp max: 150°C; ComponentLink3URL: https://www.digikey.com/en/products/detail/murata-electronics/GCG188L8EE105KA07D/10695125; Package: 0603 (1608 Metric); MPN: GCG188L8EE105KA07D; ComponentLink2URL: https://eu.mouser.com/ProductDetail/Murata-Electronics/GCG188L8EE105KA07D?qs=rrS6PyfT74dFMfTR80dVTA%3D%3D; Dielectric: X8L; Size: 1.60mm x 0.80mm; ComponentLink1Description: Datasheet; ComponentLink1URL: https://www.murata.com/en-us/products/productdetail?partno=GCG188L8EE105KA07%23; ComponentLink2Description: Mouser; Height max: 900µm; Mounting Type: SM; ComponentLink3Description: Digikey; Lead Spacing: 0mm; Ratings: AEC-Q200
FB6 = CMP-001-1981-1: as FB1 on sheet MCU; Mounting Type: SM; Size: 1.60mm x 0.80mm; ComponentLink2URL: https://eu.mouser.com/ProductDetail/Murata-Electronics/BLM18KG221BH1D?qs=sJ5gq5MLFXpgEHYBdWUtkQ%3D%3D; ComponentLink1Description: Datasheet; ComponentLink1URL: https://www.murata.com/en-us/products/productdata/8798137286686/QNFA9129.pdf; Lead Spacing: 0mm; Ratings: AEC-Q200; ComponentLink3Description: Digikey; ComponentLink3URL: https://www.digikey.com/en/products/detail/murata-electronics/BLM18KG221BH1D/6156000; Height max: 950µm; Package: 0603 (1608 Metric); ComponentLink2Description: Mouser; MPN: BLM18KG221BH1D
R78 = CMP-001-0927-2: as R240 on sheet MCU; Height max: 550µm; ComponentLink2URL: https://eu.mouser.com/ProductDetail/YAGEO/RC0603FR-070RL?qs=0yPvnVz5%2FmpDQv43TwvCfw%3D%3D; Temperature Coefficient: -; ComponentLink3Description: Digikey; ComponentLink2Description: Mouser; MPN: RC0603FR-070RL; ComponentLink1URL: https://www.yageo.com/upload/media/product/productsearch/datasheet/rchip/PYu-RC_Group_51_RoHS_L_12.pdf; Ratings: -; Size: 1.60mm x 0.80mm; Composition: Thick Film; Mounting Type: SM; ComponentLink3URL: https://www.digikey.com/en/products/detail/yageo/RC0603FR-070RL/1304008; Package: 0603 (1608 Metric); ComponentLink1Description: Datasheet
R79-R83 R88 = CMP-001-0277-7: as R10 on sheet Flash_memory; ComponentLink1URL: https://www.yageo.com/upload/media/product/productsearch/datasheet/rchip/PYu-RC_Group_51_RoHS_L_12.pdf; ComponentLink1Description: Datasheet; MPN: RC0402FR-0747K5L; ComponentLink3Description: Digikey; ComponentLink2URL: https://eu.mouser.com/ProductDetail/YAGEO/RC0402FR-0747K5L?qs=V1yeUXFNrklfu86Rfgihxg%3D%3D; Mounting Type: SM; Tolerance: 1%; Package: 0402 (1005 Metric); Height max: 400µm; ComponentLink2Description: Mouser; ComponentLink3URL: https://www.digikey.com/en/products/detail/yageo/RC0402FR-0747K5L/726617; Size: 1.00mm x 0.50mm; Composition: Thick Film; Ratings: -
R84-R87 = CMP-001-0482-4: as R3 on sheet MCU; Ratings: -; ComponentLink3URL: https://www.digikey.com/en/products/detail/yageo/RC0402FR-0722RL/726562; ComponentLink2URL: https://eu.mouser.com/ProductDetail/YAGEO/RC0402FR-0722RL?qs=V1yeUXFNrkkRg6zf08ADKQ%3D%3D; MPN: RC0402FR-0722RL; ComponentLink1Description: Datasheet; ComponentLink3Description: Digikey; Tolerance: 1%; Size: 1.00mm x 0.50mm; ComponentLink1URL: https://www.yageo.com/upload/media/product/productsearch/datasheet/rchip/PYu-RC_Group_51_RoHS_L_12.pdf; Composition: Thick Film; ComponentLink2Description: Mouser; Mounting Type: SM; Package: 0402 (1005 Metric); Height max: 400µm
U11 = 25LC256-H/SN: IC EEPROM 256KBIT SPI 5MHZ 8SOIC; Manufacturer: Microchip Technology; MPN: 25LC256-H/SN